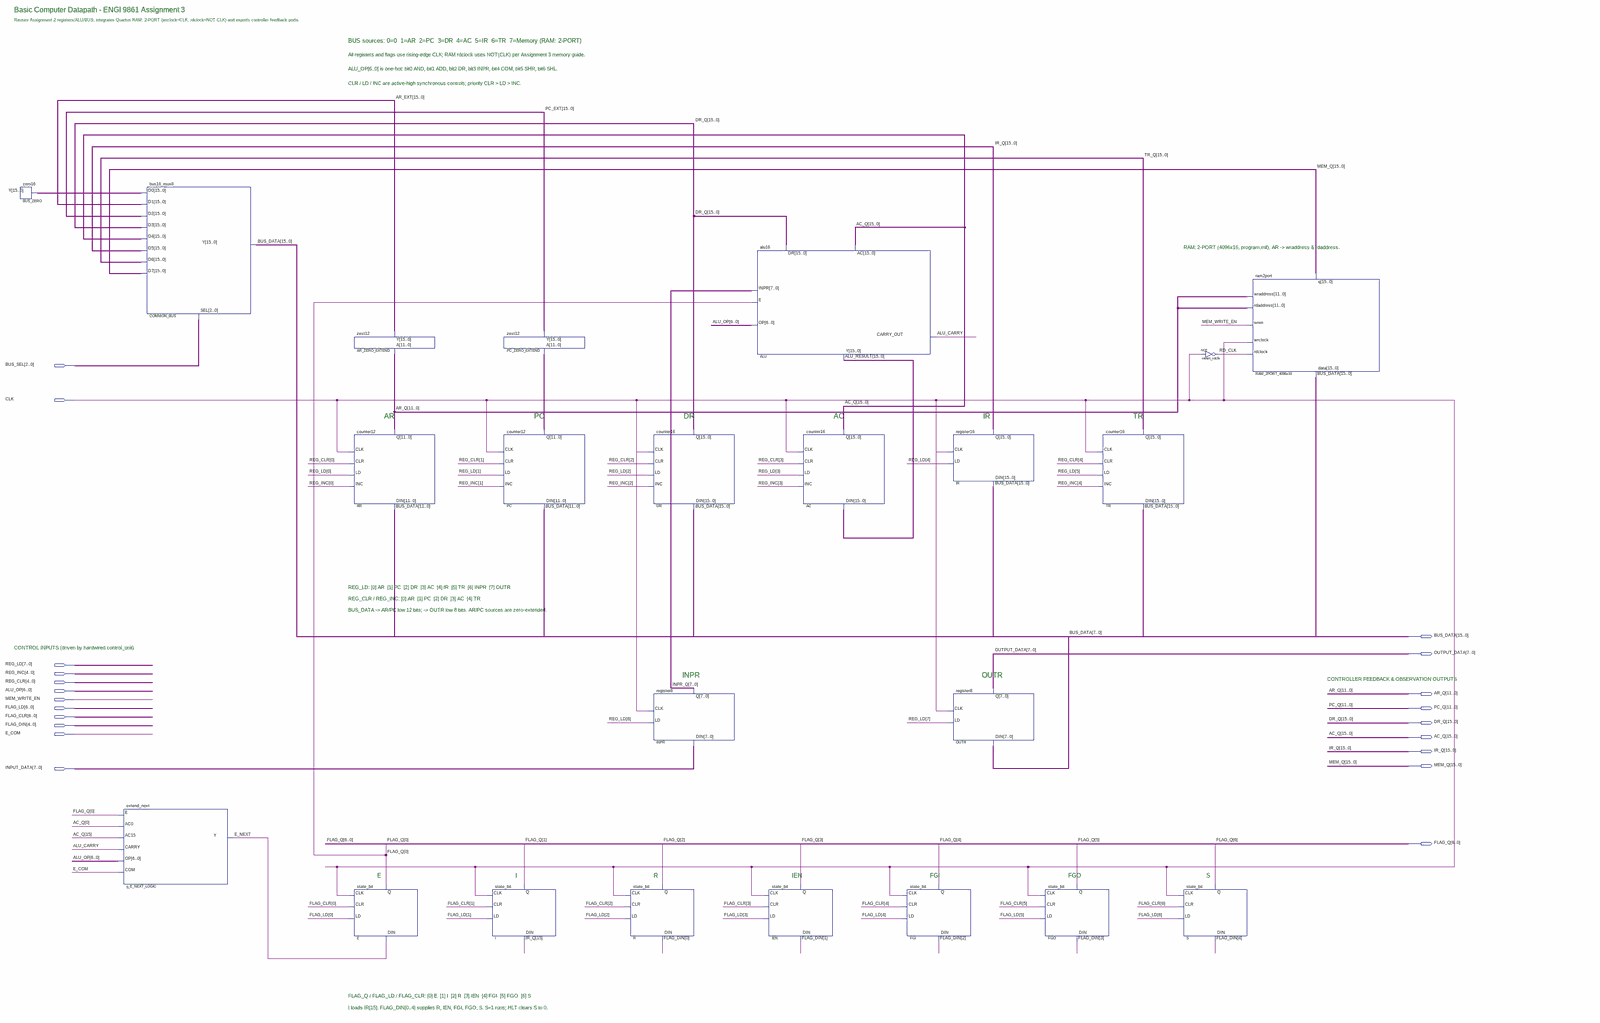
[diagram p0: schematic sheet, whole]
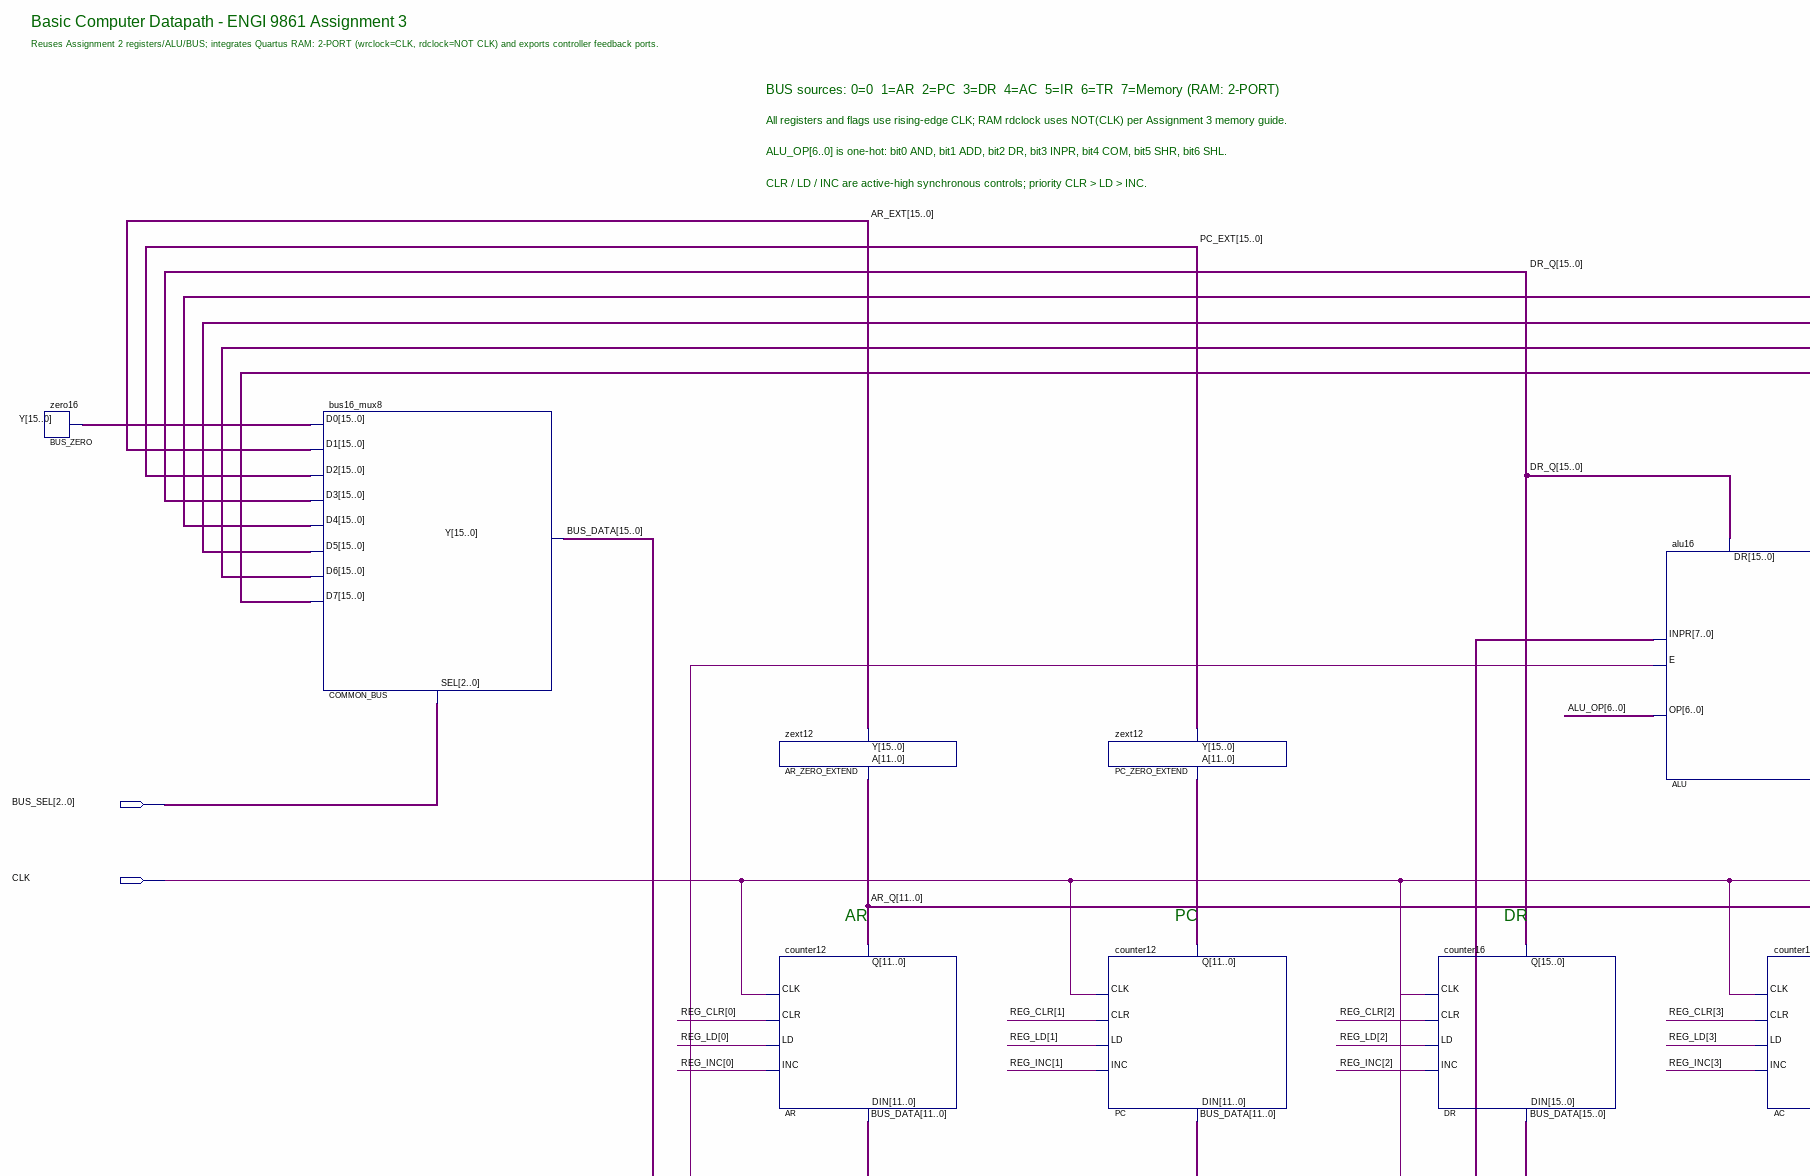
[diagram p1: schematic sheet, upper left part]
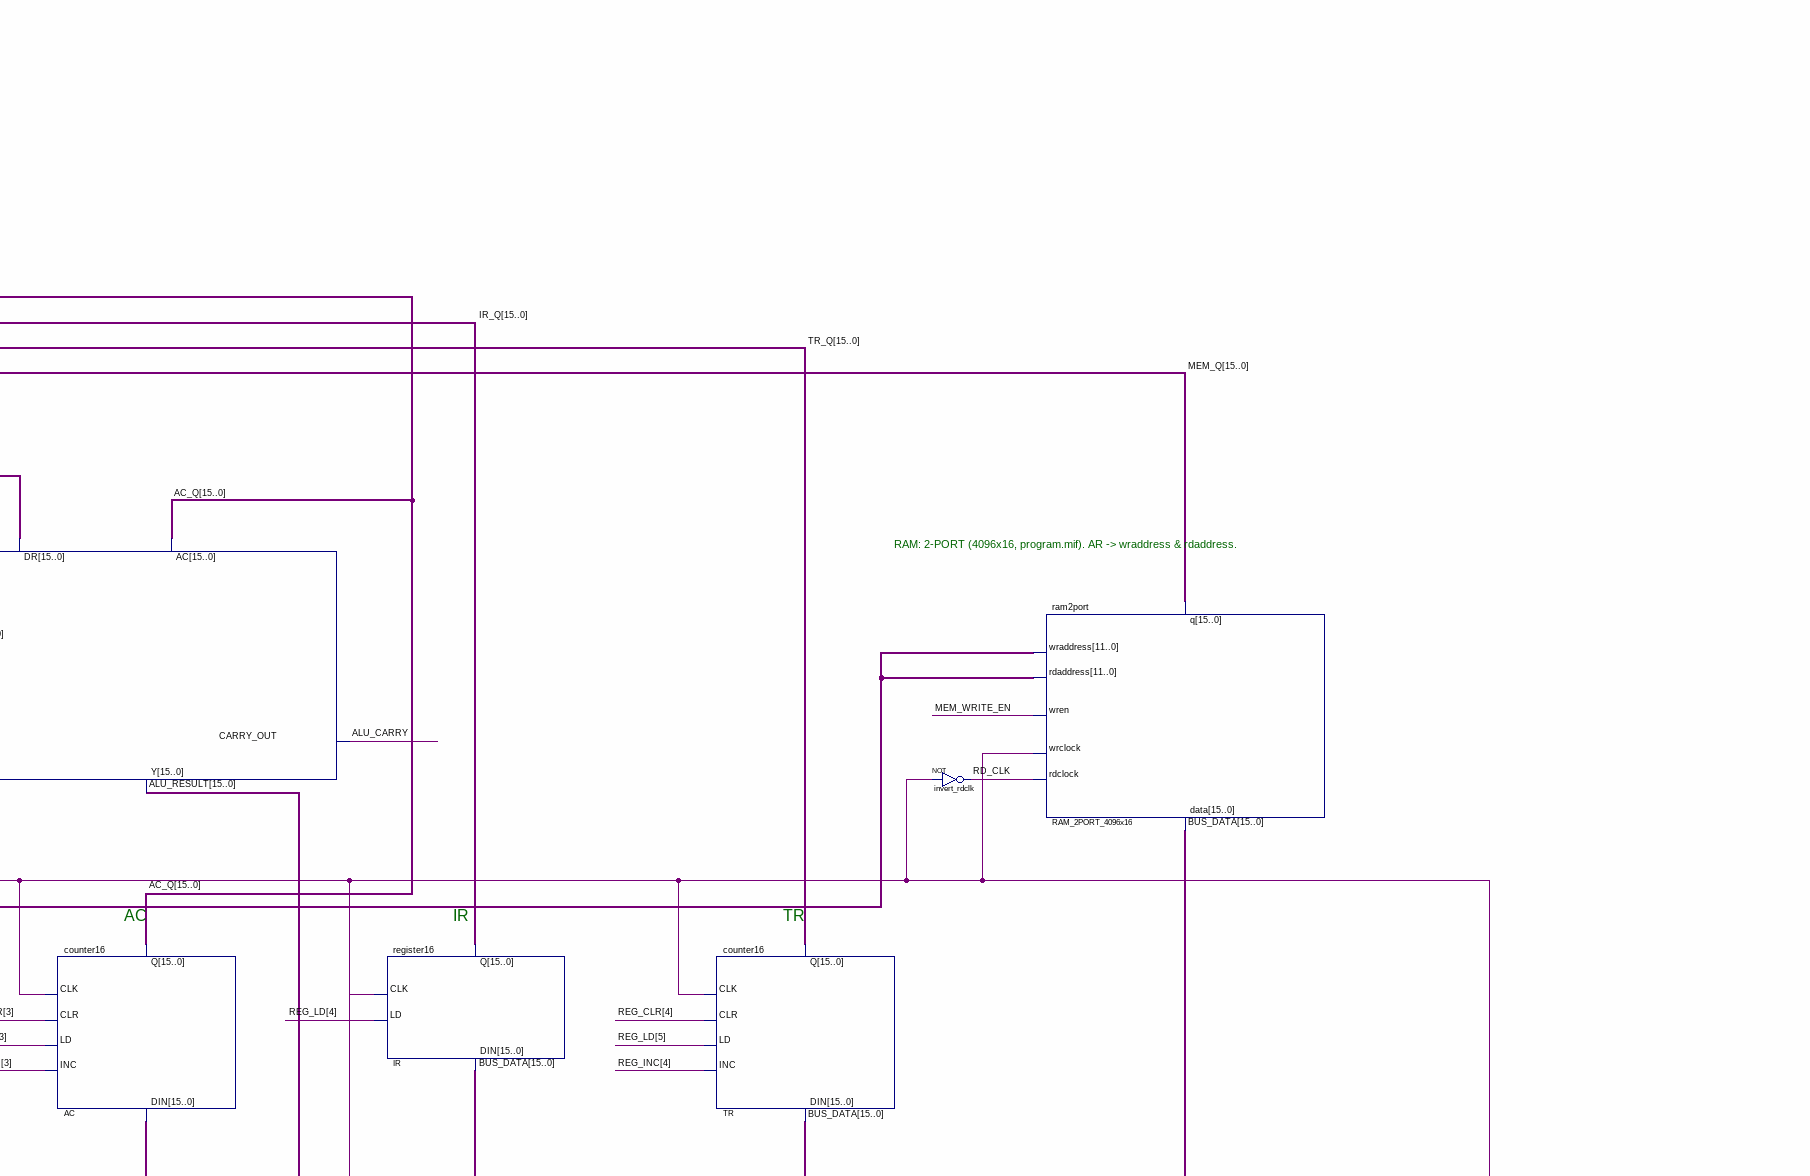
[diagram p2: schematic sheet, upper right part]
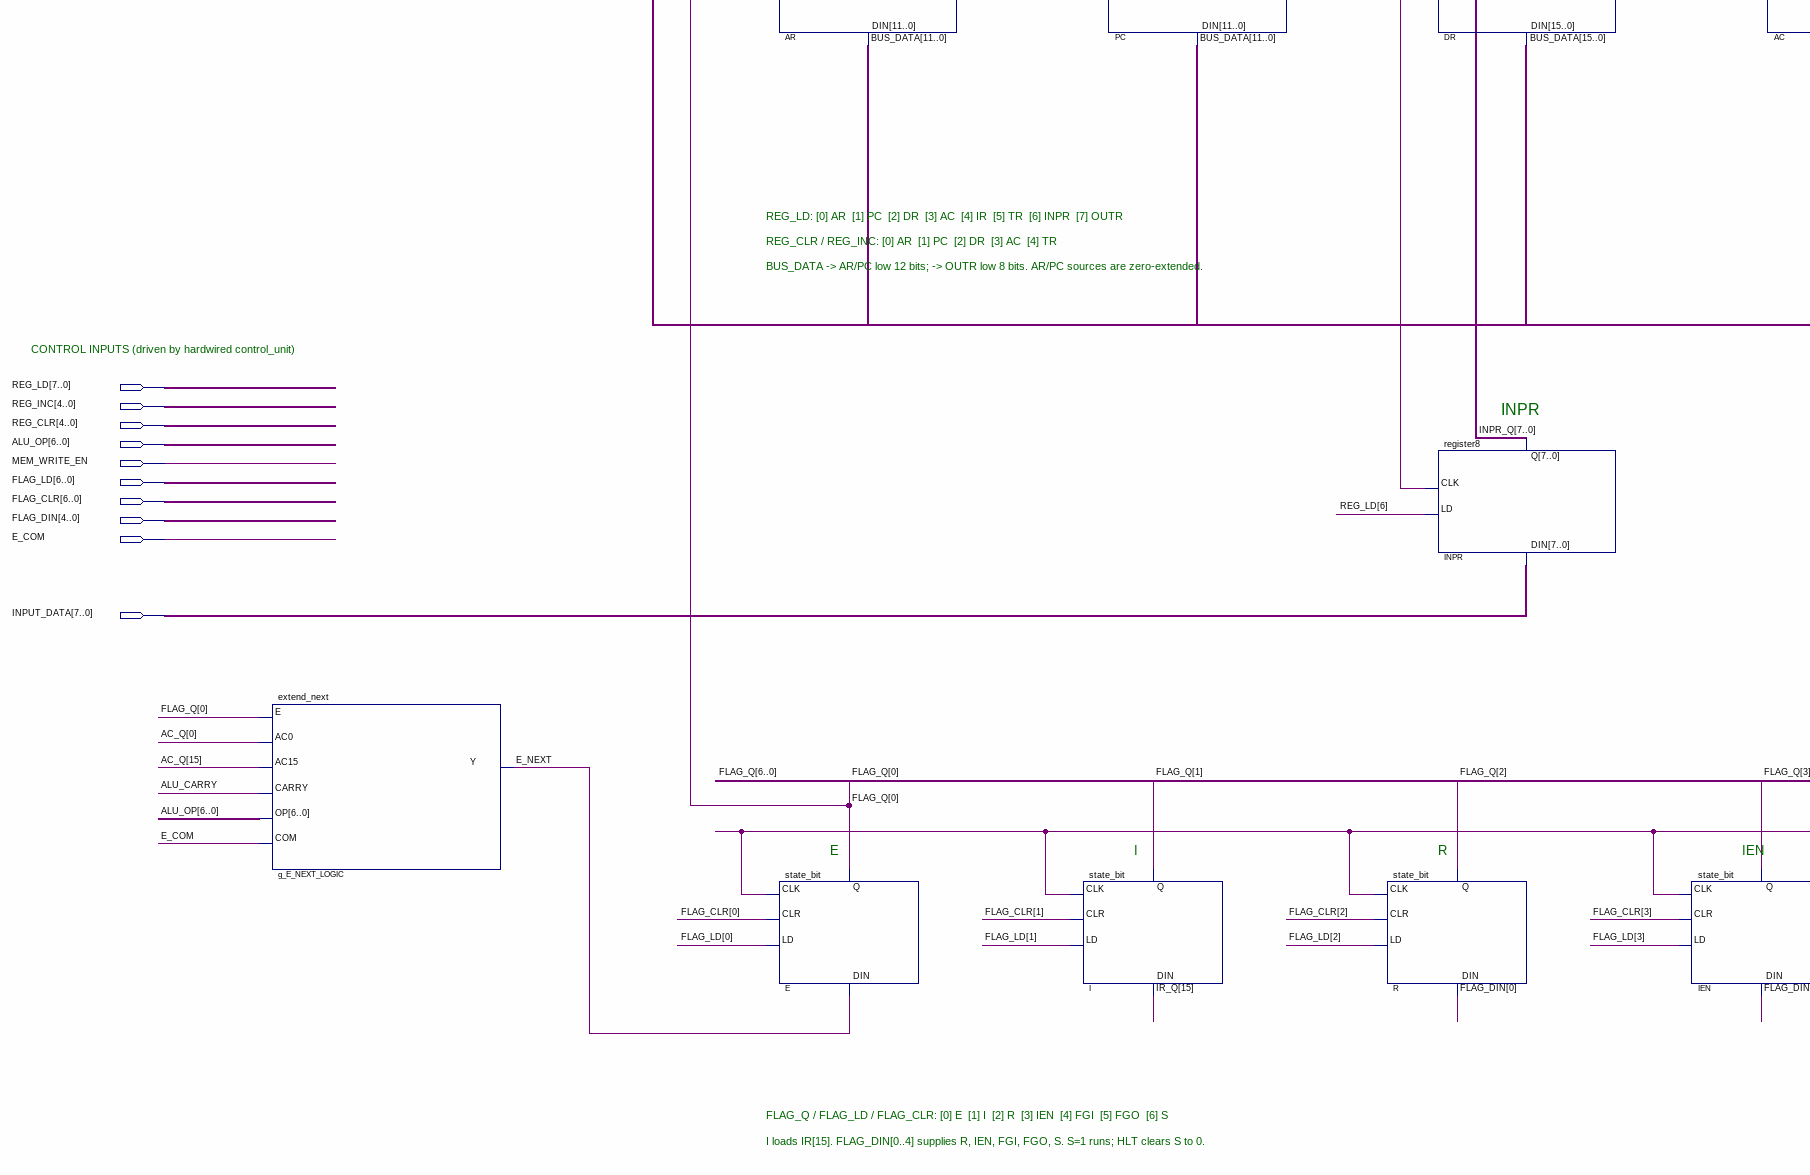
[diagram p3: schematic sheet, lower left part]
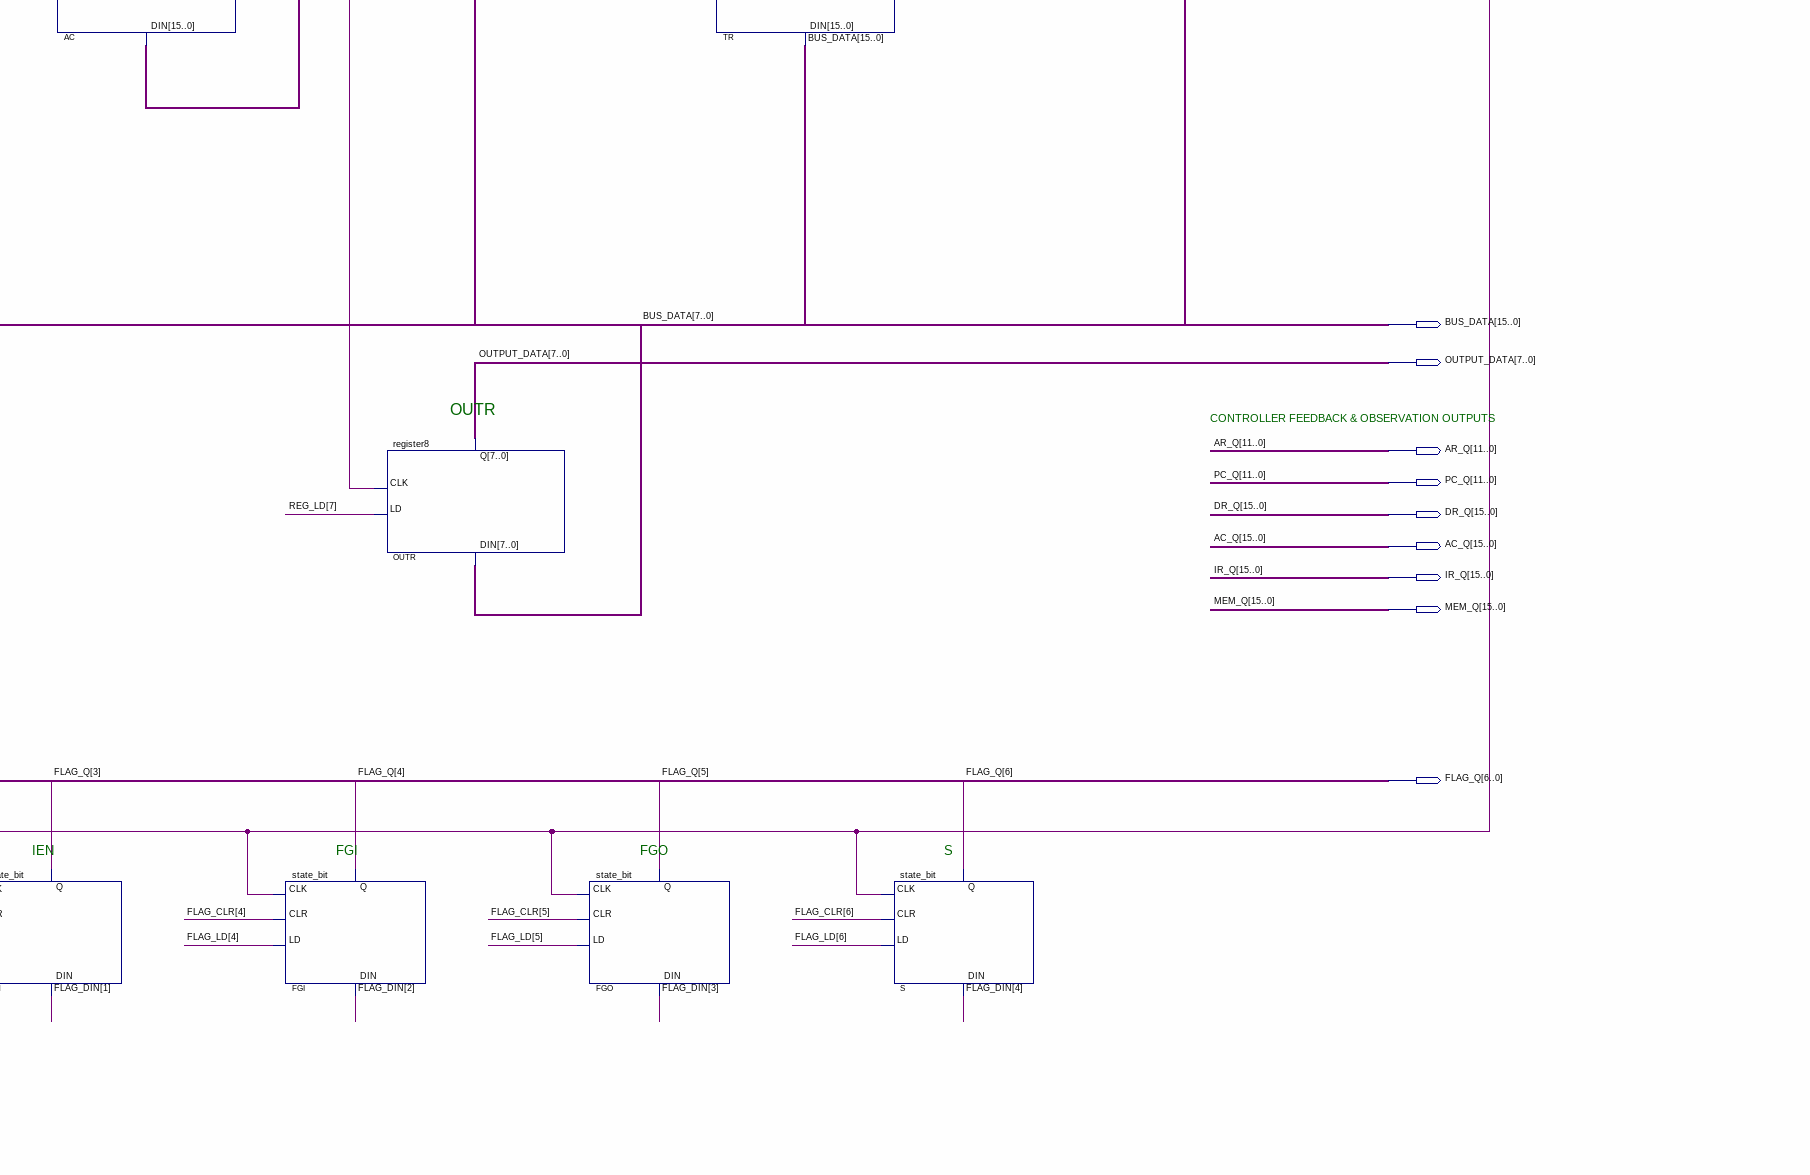
[diagram p4: schematic sheet, lower right part]
// Quartus schematic datapath.bdf as structural Verilog: 23 symbols, 21 pins
module datapath (
  input  [2:0] BUS_SEL,
  input  CLK,
  input  [7:0] REG_LD,
  input  [4:0] REG_INC,
  input  [4:0] REG_CLR,
  input  [6:0] ALU_OP,
  input  MEM_WRITE_EN,
  input  [6:0] FLAG_LD,
  input  [6:0] FLAG_CLR,
  input  [4:0] FLAG_DIN,
  input  E_COM,
  input  [7:0] INPUT_DATA,
  output [15:0] BUS_DATA,
  output [7:0] OUTPUT_DATA,
  output [11:0] AR_Q,
  output [11:0] PC_Q,
  output [15:0] DR_Q,
  output [15:0] AC_Q,
  output [15:0] IR_Q,
  output [15:0] MEM_Q,
  output [6:0] FLAG_Q
);

  wire ALU_CARRY, E_NEXT, RD_CLK;
  wire [7:0] INPR_Q;
  wire [15:0] ALU_RESULT, AR_EXT, CONST_ZERO, PC_EXT, TR_Q;

  zero16 BUS_ZERO (.Y(CONST_ZERO));
  extend_next g_E_NEXT_LOGIC (
    .E(FLAG_Q[0]), .AC0(AC_Q[0]), .AC15(AC_Q[15]), .CARRY(ALU_CARRY), .OP(ALU_OP), .COM(E_COM), .Y(E_NEXT));
  bus16_mux8 COMMON_BUS (
    .D0(CONST_ZERO), .D1(AR_EXT), .D2(PC_EXT), .D3(DR_Q), .D4(AC_Q), .D5(IR_Q), .D6(TR_Q), .D7(MEM_Q),
    .SEL(BUS_SEL), .Y(BUS_DATA));
  zext12 AR_ZERO_EXTEND (.A(AR_Q), .Y(AR_EXT));
  counter12 AR (.CLK(CLK), .CLR(REG_CLR[0]), .LD(REG_LD[0]), .INC(REG_INC[0]), .DIN(BUS_DATA[11:0]), .Q(AR_Q));
  state_bit E (.CLK(CLK), .CLR(FLAG_CLR[0]), .LD(FLAG_LD[0]), .DIN(E_NEXT), .Q(FLAG_Q[0]));
  zext12 PC_ZERO_EXTEND (.A(PC_Q), .Y(PC_EXT));
  counter12 PC (.CLK(CLK), .CLR(REG_CLR[1]), .LD(REG_LD[1]), .INC(REG_INC[1]), .DIN(BUS_DATA[11:0]), .Q(PC_Q));
  state_bit I (.CLK(CLK), .CLR(FLAG_CLR[1]), .LD(FLAG_LD[1]), .DIN(IR_Q[15]), .Q(FLAG_Q[1]));
  state_bit R (.CLK(CLK), .CLR(FLAG_CLR[2]), .LD(FLAG_LD[2]), .DIN(FLAG_DIN[0]), .Q(FLAG_Q[2]));
  counter16 DR (.CLK(CLK), .CLR(REG_CLR[2]), .LD(REG_LD[2]), .INC(REG_INC[2]), .DIN(BUS_DATA), .Q(DR_Q));
  register8 INPR (.CLK(CLK), .LD(REG_LD[6]), .DIN(INPUT_DATA), .Q(INPR_Q));
  alu16 ALU (.DR(DR_Q), .AC(AC_Q), .INPR(INPR_Q), .E(FLAG_Q[0]), .OP(ALU_OP), .Y(ALU_RESULT), .CARRY_OUT(ALU_CARRY));
  state_bit IEN (.CLK(CLK), .CLR(FLAG_CLR[3]), .LD(FLAG_LD[3]), .DIN(FLAG_DIN[1]), .Q(FLAG_Q[3]));
  counter16 AC (.CLK(CLK), .CLR(REG_CLR[3]), .LD(REG_LD[3]), .INC(REG_INC[3]), .DIN(ALU_RESULT), .Q(AC_Q));
  state_bit FGI (.CLK(CLK), .CLR(FLAG_CLR[4]), .LD(FLAG_LD[4]), .DIN(FLAG_DIN[2]), .Q(FLAG_Q[4]));
  register16 IR (.CLK(CLK), .LD(REG_LD[4]), .DIN(BUS_DATA), .Q(IR_Q));
  register8 OUTR (.CLK(CLK), .LD(REG_LD[7]), .DIN(BUS_DATA[7:0]), .Q(OUTPUT_DATA));
  state_bit FGO (.CLK(CLK), .CLR(FLAG_CLR[5]), .LD(FLAG_LD[5]), .DIN(FLAG_DIN[3]), .Q(FLAG_Q[5]));
  counter16 TR (.CLK(CLK), .CLR(REG_CLR[4]), .LD(REG_LD[5]), .INC(REG_INC[4]), .DIN(BUS_DATA), .Q(TR_Q));
  state_bit S (.CLK(CLK), .CLR(FLAG_CLR[6]), .LD(FLAG_LD[6]), .DIN(FLAG_DIN[4]), .Q(FLAG_Q[6]));
  not invert_rdclk (RD_CLK, CLK);
  ram2port RAM_2PORT_4096x16 (
    .wraddress(AR_Q), .rdaddress(AR_Q), .wren(MEM_WRITE_EN), .wrclock(CLK), .rdclock(RD_CLK),
    .data(BUS_DATA), .q(MEM_Q));

  // Notes on the sheet:
  //   Basic Computer Datapath - ENGI 9861 Assignment 3
  //   Reuses Assignment 2 registers/ALU/BUS; integrates Quartus RAM: 2-PORT (wrclock=CLK, rdclock=NOT CLK) and exports controller feedback ports.
  //   BUS sources: 0=0  1=AR  2=PC  3=DR  4=AC  5=IR  6=TR  7=Memory (RAM: 2-PORT)
  //   All registers and flags use rising-edge CLK; RAM rdclock uses NOT(CLK) per Assignment 3 memory guide.
  //   ALU_OP[6..0] is one-hot: bit0 AND, bit1 ADD, bit2 DR, bit3 INPR, bit4 COM, bit5 SHR, bit6 SHL.
  //   CLR / LD / INC are active-high synchronous controls; priority CLR > LD > INC.
  //   RAM: 2-PORT (4096x16, program.mif). AR -> wraddress & rdaddress.
  //   AR
  //   PC
  //   DR
  //   AC
  //   IR
  //   TR
  //   REG_LD: [0] AR  [1] PC  [2] DR  [3] AC  [4] IR  [5] TR  [6] INPR  [7] OUTR
  //   REG_CLR / REG_INC: [0] AR  [1] PC  [2] DR  [3] AC  [4] TR
  //   BUS_DATA -> AR/PC low 12 bits; -> OUTR low 8 bits. AR/PC sources are zero-extended.
  //   CONTROL INPUTS (driven by hardwired control_unit)
  //   INPR
  //   OUTR
  //   CONTROLLER FEEDBACK & OBSERVATION OUTPUTS
  //   E
  //   I
  //   R
  //   IEN
  //   FGI
  //   FGO
  //   S
  //   FLAG_Q / FLAG_LD / FLAG_CLR: [0] E  [1] I  [2] R  [3] IEN  [4] FGI  [5] FGO  [6] S
  //   I loads IR[15]. FLAG_DIN[0..4] supplies R, IEN, FGI, FGO, S. S=1 runs; HLT clears S to 0.
endmodule
